# EasyEDA Pro project RM26.epro, board PCB5
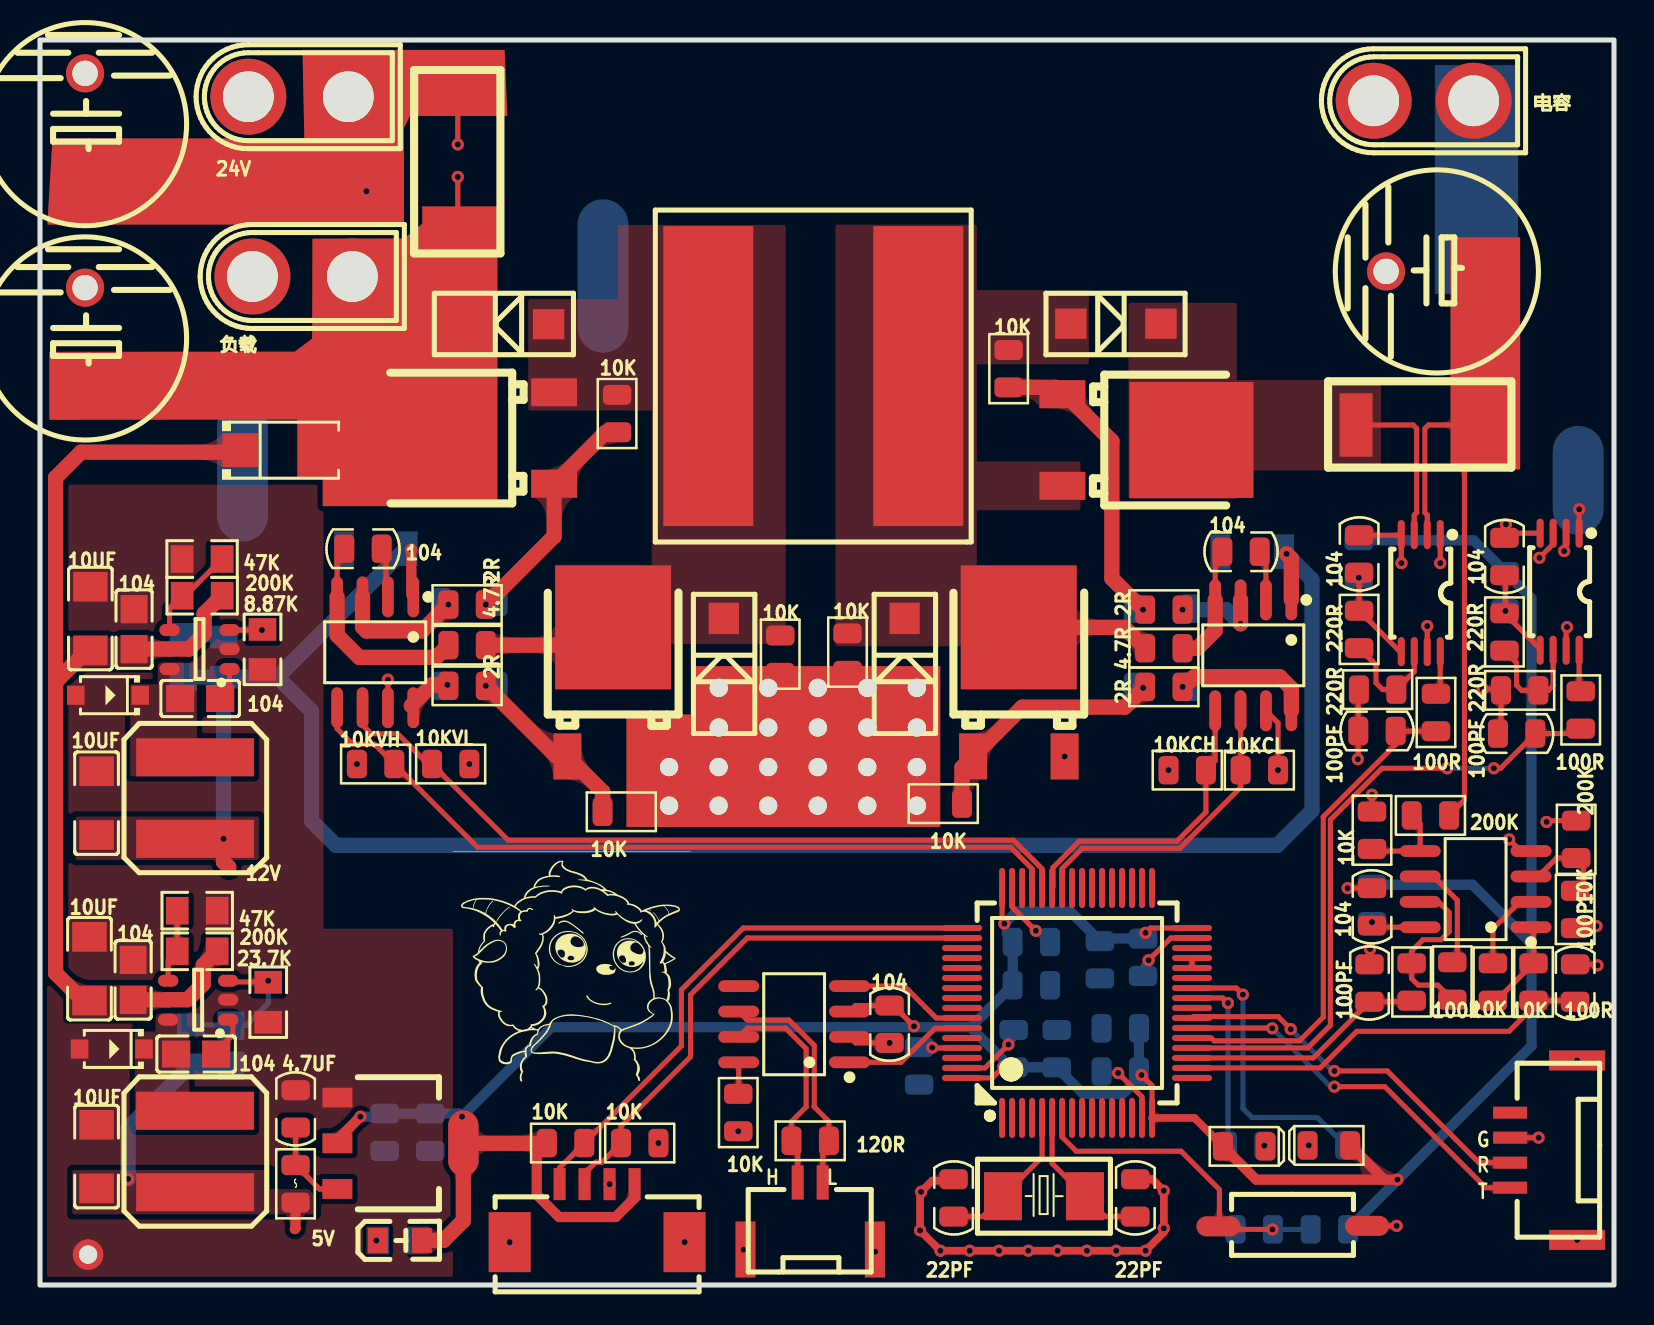
[diagram p4: board, top side]
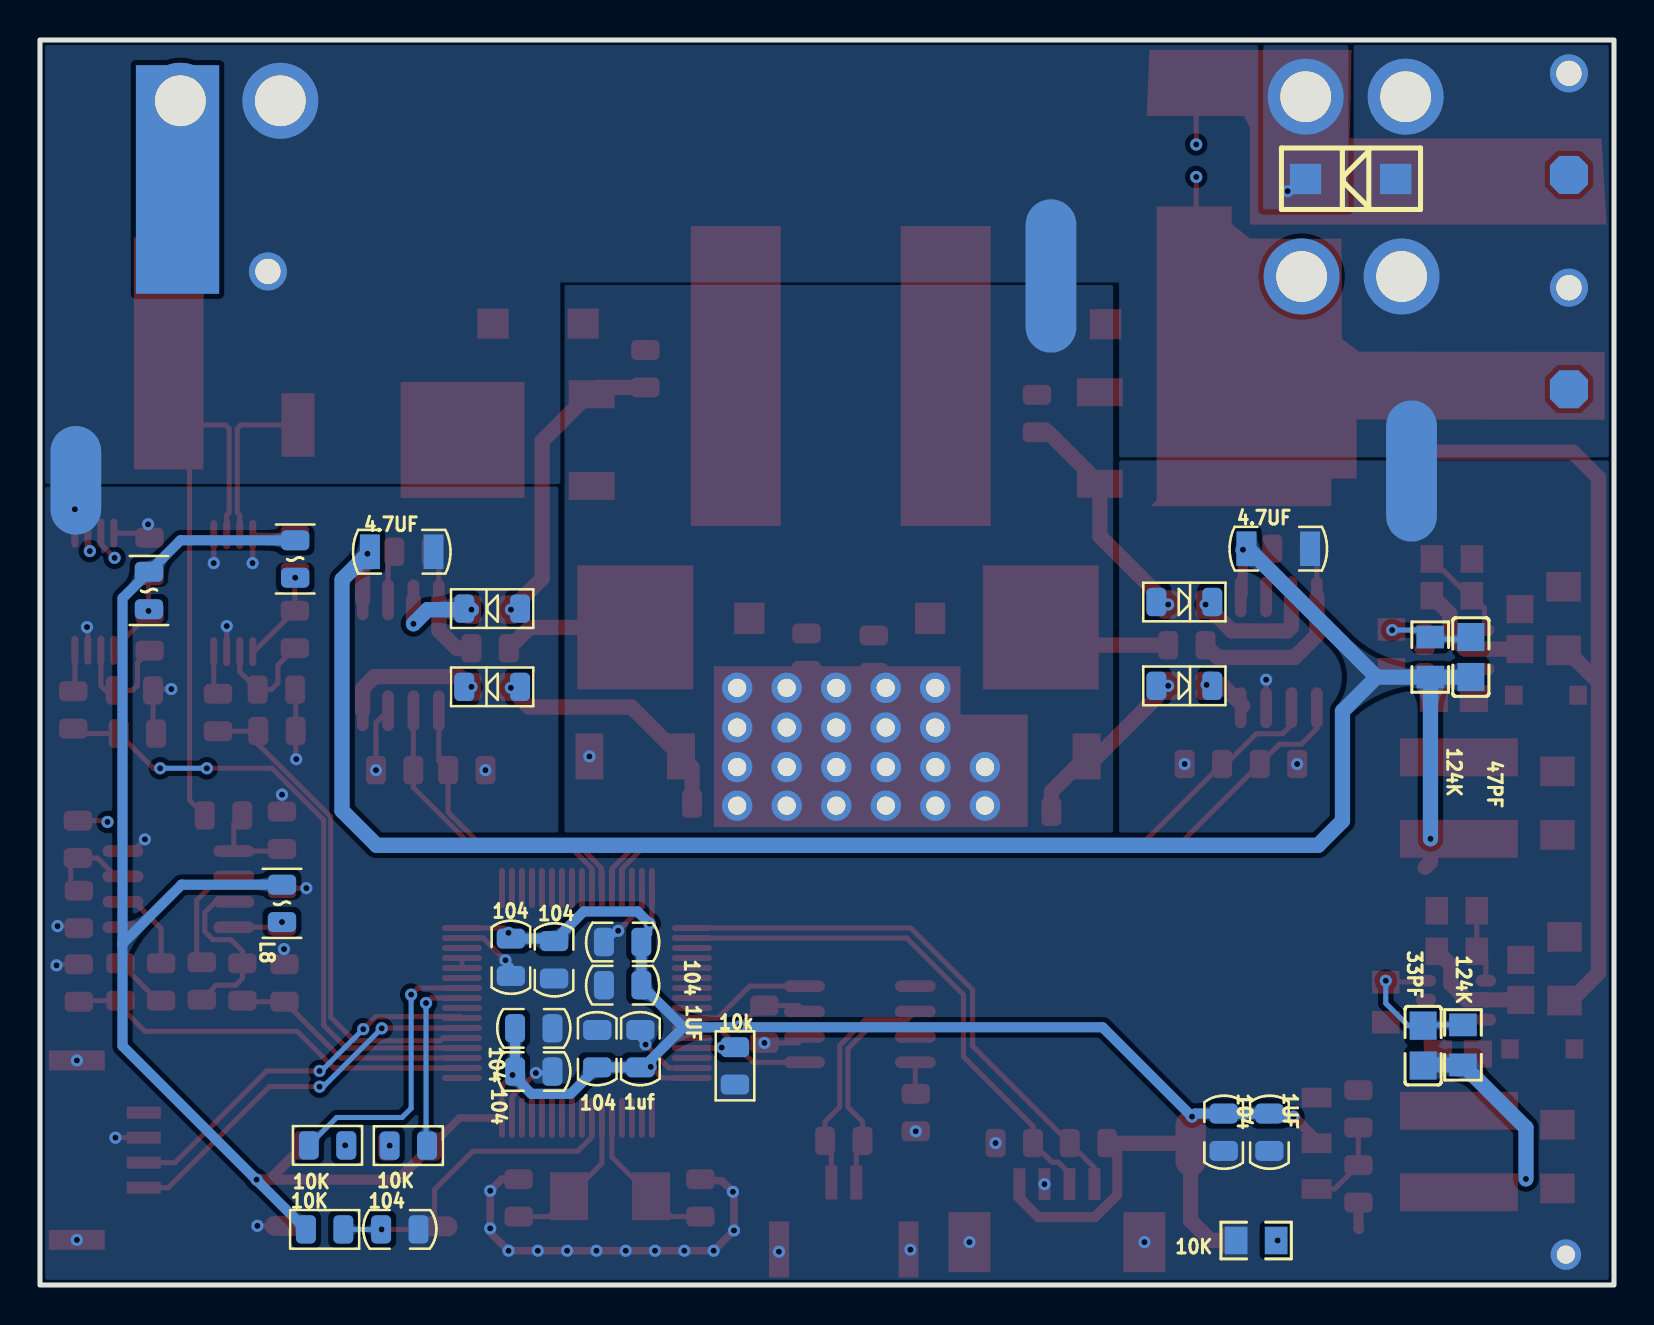
[diagram p5: board, bottom side, seen from below]

Outline 78.73 x 62.27 mm; copper layers: Top Layer, 内层1, Inner2, Bottom Layer. Coordinates in mm from the lower left corner of the outline.
Outline path: rectangle 0,62.27 78.73,0
Stack: Top Layer 0.035mm 外层铜厚1oz / Dielectric1 0.2104mm 7628 RC49% 8.6mil / 内层1 0.0152mm 内层铜厚 / Dielectric2 1.065mm 1.1mm H/HOZ Copper / Inner2 0.0152mm 内层铜厚 / Dielectric3 0.2104mm 7628 RC49% 8.6mil / Bottom Layer 0.035mm 外层铜厚1oz

## Design rules (mm)
template: 自定义配置
spacing copperThickness1oz (default): track to track 0.102, other pairs 0.152 to 0.3
spacing copperThickness2oz: track to track 0.203, other pairs 0.152 to 0.3
track width copperThickness1oz (default): min 0.127, default 0.254, max 2.54
track width copperThickness2oz: min 0.203, default 0.254, max 2.54
differential pair differentialPair (default): width min 0.127, default 0.254, max 2.54; gap min 0.152, default 0.152
via viaSize (default): diameter min 0.5, default 0.61, max 10; hole min 0.3, default 0.305, max 6.3
net GND uses copperRegion1
net 24V_P uses copperRegion1
net 24V uses copperRegion1
net $1N3043 uses copperRegion1
net $1N3042 uses copperRegion1
net 5V uses copperRegion1
net 12V uses copperRegion1
net CAP_P uses copperRegion1
net 24V_N uses copperRegion1
net CAP_N uses copperRegion1
net $1N49246 uses copperRegion1
net $1N49733 uses copperRegion1

## Placement (name value [footprint] x y rotation side)
1UF  -  [0805-C]  17.24 7.64 270 bottom
1uf  1UF  [0805-C]  54.03 12.84 180 bottom
1UF#2  -  [0805-C]  50.86 11.82 90 bottom
2R  -  [0805-R]  21.36 29.97 180 top
2R#2  -  [0805-R]  21.36 34.03 180 top
2R#3  -  [0805-R]  56.21 29.92 0 top
2R#4  -  [0805-R]  56.21 33.78 0 top
4.7R  -  [0805-R]  21.36 32 180 top
4.7R#2  -  [0805-R]  56.21 31.85 0 top
4.7UF  -  [0805-C]  12.79 8.81 90 top
4.7UF#2  -  [C-1206]  16.79 36.83 180 bottom
4.7UF#3  -  [C-1206]  60.63 36.67 0 bottom
5V  -  [Test-Point-0.5mm]  12.75 2.8 270 top
8.87K  8.87kΩ  [R0805]  11.13 31.79 90 top
10K  -  [0805-R]  28.86 43.59 90 top
10k  10K  [0805-R]  43.97 10.96 90 bottom
10K#2  -  [0805-R]  34.93 8.62 90 top
10K#3  -  [0805-R]  37.02 31.55 270 top
10K#4  -  [0805-R]  48.45 45.83 90 top
10K#5  -  [0805-R]  40.39 31.65 270 top
10K#6  -  [0805-R]  29.08 23.67 180 top
10K#7  -  [0805-R]  45.18 24.08 0 top
10K#8  -  [0805-R]  66.62 22.75 270 top
10K#9  -  [0805-R]  76.78 18.78 90 top
10K#10  -  [0805-R]  70.64 15.21 90 top
10K#11  -  [0805-R]  72.67 15.16 90 top
10K#12  -  [0805-R]  26.29 7.1 0 top
10K#13  -  [0805-R]  30 7.1 0 top
10K#14  -  [R0805]  17.9 2.23 180 bottom
10K#15  -  [0805-R]  60.3 6.97 180 bottom
10K#16  -  [0805-R]  64.35 6.98 0 bottom
10K#17  -  [0805-R]  64.49 2.78 0 bottom
10KCH  10K  [0805-R]  57.38 25.75 180 top
10KCL  10K  [0805-R]  60.99 25.75 0 top
10KVH  10K  [0805-R]  16.79 26.06 180 top
10KVL  10K  [0805-R]  20.54 26.06 0 top
10UF  -  [C1206]  2.83 6.42 270 top
10UF#2  -  [C1206]  2.52 33.33 90 top
10UF#3  -  [C1206]  2.83 24.1 270 top
10UF#4  -  [C1206]  2.47 15.82 90 top
12V  -  [Test-Point-0.5mm]  9.45 20.89 270 top
22PF  -  [0805-C]  45.7 4.36 270 top
22PF#2  -  [0805-C]  54.79 4.36 90 top
23.7K  23.7kΩ  [R0805]  11.42 14.14 90 top
24V  XT30U-M  [CONN-TH_XT30U-M]  13.12 50.44 180 top
33PF  33pF  [C0805]  9.55 11.97 90 bottom
47K  -  [R0805]  8.11 36.31 0 top
47K#2  -  [R0805]  7.86 18.72 180 top
47PF  47pF  [C0805]  7.16 31.41 270 bottom
100PF  -  [0805-C]  66.87 27.71 180 top
100PF#2  -  [0805-C]  73.86 27.58 180 top
100PF#3  -  [0805-C]  76.79 15.1 90 top
100PF#4  -  [0805-C]  66.5 15.1 90 top
100R  -  [0805-R]  77.06 28.76 270 top
100R#2  -  [0805-R]  69.83 28.64 270 top
100R#3  -  [0805-R]  74.7 15.16 270 top
100R#4  -  [0805-R]  68.61 15.16 270 top
104  -  [C0805]  8.01 29.33 180 top
104#2  -  [C0805]  7.81 11.55 180 top
104#3  -  [C0805]  4.7 32.81 90 top
104#4  -  [C0805]  4.66 15.26 90 top
104#5  -  [0805-C]  66.63 18.91 90 top
104#6  -  [0805-C]  65.98 36.56 270 top
104#7  -  [0805-C]  73.25 36.44 270 top
104#8  -  [0805-C]  42.5 13.04 90 top
104#9  -  [0805-C]  16.16 36.83 180 top
104#10  -  [0805-C]  60.07 36.67 0 top
104#11  -  [0805-C]  19.52 7.64 270 bottom
104#12  -  [0805-C]  60.73 2.78 180 bottom
104#13  -  [0805-C]  55.18 16.39 270 bottom
104#14  -  [0805-C]  49.59 17.15 0 bottom
104#15  -  [0805-C]  54.03 10.68 180 bottom
104#16  -  [0805-C]  49.59 15 0 bottom
104#17  -  [0805-C]  53.02 16.27 270 bottom
104#18  -  [0805-C]  48.7 11.82 90 bottom
120R  120R  [0805-R]  38.52 7.21 0 top
124K  -  [R0805]  9.19 31.41 270 bottom
124K#2  -  [R0805]  7.55 12.01 270 bottom
200K  -  [R0805]  8.11 34.48 0 top
200K#2  -  [R0805]  7.86 16.69 0 top
200K#3  -  [0805-R]  69.55 23.49 180 top
200K#4  -  [0805-R]  76.84 22.29 270 top
220R  -  [0805-R]  73.25 32.66 90 top
220R#2  -  [0805-R]  65.98 32.79 90 top
220R#3  -  [0805-R]  74.01 29.74 180 top
220R#4  -  [0805-R]  66.9 29.78 180 top
C3  470UF  [C-电解电容]  2.25 58.06 90 top
C23  470UF  [C-电解电容]  69.87 50.7 180 top
C27  470UF  [C-电解电容]  2.25 47.34 90 top
D1  SMBJ30CA  [SMA]  13.18 55.32 0 bottom
D3  1N5819  [SMA_L4.4-W2.6-LS5.0-RD]  12.21 41.75 0 top
D4  1N4148W  [SOD-123_L2.7-W1.6-LS3.7-FD]  3.4 29.5 0 top
D5  1N4148W  [SOD-123_L2.7-W1.6-LS3.7-FD]  3.59 11.81 0 top
D16  led  [0805-LED]  60.24 6.93 0 top
D17  led  [0805-LED]  64.47 6.98 180 top
D24  1n4148  [1n4148 sod-123]  21.49 29.97 180 bottom
D25  1n4148  [1n4148 sod-123]  21.49 34.16 180 bottom
D26  FR107  [SMA]  34.21 31.09 90 top
D27  FR107  [SMA]  43.25 31.09 90 top
D28  FR107  [SMA]  53.82 48.08 0 top
D29  1n4148  [1n4148 sod-123]  56.11 29.92 0 bottom
D30  1n4148  [1n4148 sod-123]  56.11 33.83 0 bottom
D31  FR107  [SMA]  23.18 48.05 180 top
F1  0.5A/0805  [自恢复保险丝-0805]  12.78 5.06 90 top
IC1  OPA2350UA  [OPA2350UA-SOP-8]  71.81 19.8 180 top
J4  CON4  [GH1.25-4P  SWD]  27.86 3.59 0 top
J5  CON2  [GH1.25_2P-立]  38.52 3.45 0 top
J7  CON4  [GH1.25_4P-立]  75.21 6.74 90 top
L3  3.3UH/0530  [L-5020/5030]  7.76 6.68 0 top
L4  10UH  [0805-L]  73.28 34.74 90 bottom
L5  10UH  [0805-L]  65.96 36.31 90 bottom
L8  10UH  [0805-L]  66.62 19.09 90 bottom
L10  15uH  [IND-SMD_L16.5-W15.5]  38.68 45.46 180 top
L11  6.8UH/0530  [L-5020/5030]  7.76 24.35 0 top
LED2  -  [LED_0805]  18.05 2.23 0 top
NOREF  -  [Pad_e4455]  36.43 29.87 0 top
NOREF#2  -  [Pad_e4452]  43.86 29.87 0 top
NOREF#3  -  [Pad_e4465]  36.42 25.91 0 top
NOREF#4  -  [Pad_e4462]  41.38 23.97 0 top
NOREF#5  -  [Pad_e4450]  43.86 25.91 0 top
NOREF#6  -  [Pad_e495]  37.18 26.93 0 top
NOREF#7  -  [Pad_e341]  71.85 55.29 0 top
NOREF#8  -  [Pad_e493]  11.82 44.98 0 top
NOREF#9  -  [Pad_e4454]  38.91 29.87 0 top
NOREF#10  -  [Pad_e4456]  33.95 29.87 0 top
NOREF#11  -  [Pad_e4458]  36.43 27.88 0 top
NOREF#12  -  [Pad_e4449]  43.86 23.97 0 top
NOREF#13  -  [Pad_e4470]  31.46 23.97 0 top
NOREF#14  -  [Pad_e4461]  41.38 25.91 0 top
NOREF#15  -  [Pad_e4459]  38.91 27.88 0 top
NOREF#16  -  [Pad_e2899]  2.41 1.52 0 top
NOREF#17  -  [Pad_e4457]  33.95 27.88 0 top
NOREF#18  -  [Pad_e4451]  43.86 27.88 0 top
NOREF#19  -  [Pad_e4463]  38.9 23.97 0 top
NOREF#20  -  [Pad_e4464]  38.9 25.91 0 top
NOREF#21  -  [Pad_e492]  11.87 55.19 0 top
NOREF#22  -  [Pad_e4468]  33.94 23.97 0 top
NOREF#23  -  [Pad_e4466]  36.42 23.97 0 top
NOREF#24  -  [Pad_e4460]  41.38 27.88 0 top
NOREF#25  -  [Pad_e4467]  33.94 25.91 0 top
NOREF#26  -  [Pad_e4453]  41.38 29.87 0 top
NOREF#27  -  [Pad_e340]  72.29 46.59 0 top
NOREF#28  -  [Pad_e4469]  31.46 25.91 0 top
Q27  TMGN10080D  [TO-252-3_L6.5-W6.1-P4.58-BR]  22.49 42.36 0 top
Q28  TMGN10080D  [TO-252-3_L6.5-W6.1-P4.58-BR]  28.67 29.66 270 top
Q29  TMGN10080D  [TO-252-3_L6.5-W6.1-P4.58-BR]  54.37 42.26 180 top
Q30  TMGN10080D  [TO-252-3_L6.5-W6.1-P4.58-BR]  48.96 29.66 270 top
R1  R005  [R-2512]  20.9 56.23 270 top
R27  R005  [R-2512]  69.06 43.02 180 top
S1  -  [按键]  62.66 2.95 180 top
U3  mp2451  [MP2451-SOT23-6]  7.98 31.78 180 top
U4  mp2451  [MP2451-SOT23-6]  7.91 14.25 180 top
U6  AMS1117  [AMS117-SOT-223]  18.03 7.09 270 top
U8  INA240A1PWR  [INA240-TSSOP-8]  76.01 34.68 270 top
U9  INA240A1PWR  [INA240-TSSOP-8]  69.06 34.6 270 top
U14  STM32G474RET6  [LQFP-64_L10.0-W10.0-P0.50-LS12.0-BL]  51.87 14.11 0 top
U15  SN65HVD230  [SOP-8]  37.72 13.04 180 top
U16  UCC27282DR  [SOIC-8_L4.9-W3.9-P1.27-LS6.0-BL]  16.77 31.65 180 top
U17  UCC27282DR  [SOIC-8_L4.9-W3.9-P1.27-LS6.0-BL]  60.68 31.49 180 top
X1  8M  [晶振2脚-5032]  50.22 4.44 180 top
电容  XT30U-M  [CONN-TH_XT30U-M]  69.21 59.23 180 top
负载  XT30U-M  [CONN-TH_XT30U-M]  12.92 59.43 180 top

## Footprints (pads in the part's own frame, mm; a bottom-side part is the same pattern mirrored in y, then rotated)
1n4148 sod-123
  rrect 1x1.42 smd: 1(-1.397,0) 2(1.397,0)
0805-C
  rrect 1x1.42 smd: 1(-0.935,0) 2(0.935,0)
0805-L
  rrect 1x1.42 smd: 1(-0.935,0) 2(0.935,0)
0805-LED
  rrect 1x1.42 smd: 1(-1.067,0) 2(1.067,0)
0805-R
  rrect 1x1.42 smd: 1(-0.935,0) 2(0.935,0)
AMS117-SOT-223
  rect 0.991x1.498 smd: 1(-2.286,-3.15) 2(0,-3.15) 3(2.286,-3.15)
  oval 3.28x1.524 smd: 2(0,3.15)
C0805
  rect 1.41x1.35 smd: 1(-1,0) 2(1,0)
C1206
  rect 1.485x1.728 smd: 1(-1.593,0) 2(1.593,0)
C-1206
  rect 1x1.728 smd: 1(-1.593,0) 2(1.593,0)
C-电解电容
  custom 1.905x1.905 hole 1.143: 1(-2.54,0)
  round 1.905 hole 1.27: 2(2.54,0)
CONN-TH_XT30U-M
  round 3.8 hole 2.54: 1(-2.5,0) 2(2.5,0)
GH1.25-4P  SWD
  rect 0.6x1.6 smd: 1(-1.875,1.45) 2(-0.625,1.45) 3(0.625,1.45) 4(1.875,1.45)
  rect 2.1x3 smd: 5(4.375,-1.45) 6(-4.375,-1.45)
GH1.25_2P-立
  rect 0.6x1.7 smd: 1(-0.625,1.675) 2(0.625,1.675)
  rect 1x2.8 smd: 3(3.237,-1.675) 4(-3.237,-1.675)
GH1.25_4P-立
  rect 0.6x1.7 smd: 1(-1.875,1.675) 2(-0.625,1.675) 3(0.625,1.675) 4(1.875,1.675)
  rect 1x2.8 smd: 5(4.487,-1.675) 6(-4.487,-1.675)
INA240-TSSOP-8
  oval 1.454x0.353 smd: 1(-2.927,0.975) 2(-2.927,0.325) 3(-2.927,-0.325) 4(-2.927,-0.975) 5(2.927,-0.975) 6(2.927,-0.325) 7(2.927,0.325) 8(2.927,0.975)
IND-SMD_L16.5-W15.5
  rect 4.5x15 smd: 1(5.25,0) 2(-5.25,0)
L-5020/5030
  rect 5.9x1.9 smd: 1(0,2.038) 2(0,-2.038)
LED_0805
  rect 1x1.25 smd: 1(-1.15,0.005) 2(1.05,0.005)
LQFP-64_L10.0-W10.0-P0.50-LS12.0-BL
  oval 0.3x2 smd: 1(-3.75,-5.75) 2(-3.25,-5.75) 3(-2.75,-5.75) 4(-2.25,-5.75) 5(-1.75,-5.75) 6(-1.25,-5.75) 7(-0.75,-5.75) 8(-0.25,-5.75) 9(0.25,-5.75) 10(0.75,-5.75) 11(1.25,-5.75) 12(1.75,-5.75) 13(2.25,-5.75) 14(2.75,-5.75) 15(3.25,-5.75) 16(3.75,-5.75) 33(3.75,5.75) 34(3.25,5.75) 35(2.75,5.75) 36(2.25,5.75) 37(1.75,5.75) 38(1.25,5.75) 39(0.75,5.75) 40(0.25,5.75) 41(-0.25,5.75) 42(-0.75,5.75) 43(-1.25,5.75) 44(-1.75,5.75) 45(-2.25,5.75) 46(-2.75,5.75) 47(-3.25,5.75) 48(-3.75,5.75)
  oval 2x0.3 smd: 17(5.75,-3.75) 18(5.75,-3.25) 19(5.75,-2.75) 20(5.75,-2.25) 21(5.75,-1.75) 22(5.75,-1.25) 23(5.75,-0.75) 24(5.75,-0.25) 25(5.75,0.25) 26(5.75,0.75) 27(5.75,1.25) 28(5.75,1.75) 29(5.75,2.25) 30(5.75,2.75) 31(5.75,3.25) 32(5.75,3.75) 49(-5.75,3.75) 50(-5.75,3.25) 51(-5.75,2.75) 52(-5.75,2.25) 53(-5.75,1.75) 54(-5.75,1.25) 55(-5.75,0.75) 56(-5.75,0.25) 57(-5.75,-0.25) 58(-5.75,-0.75) 59(-5.75,-1.25) 60(-5.75,-1.75) 61(-5.75,-2.25) 62(-5.75,-2.75) 63(-5.75,-3.25) 64(-5.75,-3.75)
MP2451-SOT23-6
  oval 1.016x0.6 smd: 1(-1.5,0.975) 2(-1.5,-0.025) 3(-1.5,-0.975) 4(1.5,-0.975) 5(1.5,-0.025) 6(1.5,0.975)
OPA2350UA-SOP-8
  oval 2.045x0.588 smd: 1(-2.772,1.905) 2(-2.772,0.635) 3(-2.772,-0.635) 4(-2.772,-1.905) 5(2.772,-1.905) 6(2.772,-0.635) 7(2.772,0.635) 8(2.772,1.905)
Pad_e340
  rect 3.482x11.608 smd: 2(0,0)
Pad_e341
  rect 4.165x11.43 smd far side: 2(0,0)
Pad_e492
  custom 23.005x8.737 smd: 1(0,0)
Pad_e493
  custom 22.71x15.04 smd: 65(0,0)
Pad_e495
  custom 15.696x8.046 smd: 66(0,0)
Pad_e2899
  round 1.524 hole 0.914: 1(0,0)
Pad_e4449
  round 1.524 hole 0.914: 1(0,0)
Pad_e4450
  round 1.524 hole 0.914: 2(0,0)
Pad_e4451
  round 1.524 hole 0.914: 3(0,0)
Pad_e4452
  round 1.524 hole 0.914: 4(0,0)
Pad_e4453
  round 1.524 hole 0.914: 5(0,0)
Pad_e4454
  round 1.524 hole 0.914: 6(0,0)
Pad_e4455
  round 1.524 hole 0.914: 7(0,0)
Pad_e4456
  round 1.524 hole 0.914: 8(0,0)
Pad_e4457
  round 1.524 hole 0.914: 9(0,0)
Pad_e4458
  round 1.524 hole 0.914: 10(0,0)
Pad_e4459
  round 1.524 hole 0.914: 11(0,0)
Pad_e4460
  round 1.524 hole 0.914: 12(0,0)
Pad_e4461
  round 1.524 hole 0.914: 13(0,0)
Pad_e4462
  round 1.524 hole 0.914: 14(0,0)
Pad_e4463
  round 1.524 hole 0.914: 15(0,0)
Pad_e4464
  round 1.524 hole 0.914: 16(0,0)
Pad_e4465
  round 1.524 hole 0.914: 17(0,0)
Pad_e4466
  round 1.524 hole 0.914: 18(0,0)
Pad_e4467
  round 1.524 hole 0.914: 19(0,0)
Pad_e4468
  round 1.524 hole 0.914: 20(0,0)
Pad_e4469
  round 1.524 hole 0.914: 21(0,0)
Pad_e4470
  round 1.524 hole 0.914: 22(0,0)
R0805
  rect 1.133x1.377 smd: 1(-1,0) 2(1,0)
R-2512
  rect 1.651x3.175 smd: 1(-3.238,0) 2(3.238,0)
SMA
  rect 1.57x1.51 smd: 1(-2.255,0) 2(2.255,0)
SMA_L4.4-W2.6-LS5.0-RD
  rect 1.8x1.7 smd: 1(-2.192,0) 2(2.192,0)
SOD-123_L2.7-W1.6-LS3.7-FD
  rect 0.88x0.96 smd: 1(-1.61,0) 2(1.61,0)
SOIC-8_L4.9-W3.9-P1.27-LS6.0-BL
  oval 0.588x2.045 smd: 1(-1.905,-2.772) 2(-0.635,-2.772) 3(0.635,-2.772) 4(1.905,-2.772) 5(1.905,2.772) 6(0.635,2.772) 7(-0.635,2.772) 8(-1.905,2.772)
SOP-8
  oval 2.045x0.588 smd: 1(-2.772,1.905) 2(-2.772,0.635) 3(-2.772,-0.635) 4(-2.772,-1.905) 5(2.772,-1.905) 6(2.772,-0.635) 7(2.772,0.635) 8(2.772,1.905)
Test-Point-0.5mm
  round 0.5 smd: 1(0,0)
TO-252-3_L6.5-W6.1-P4.58-BR
  rect 2.3x1.4 smd: 1(3.228,-2.29) 3(3.228,2.29)
  rect 6.2x5.8 smd: 2(-3.228,-0.004)
按键
  rrect 2.2x1 smd: 1(-3.721,-0.013) 2(3.721,0.013)
晶振2脚-5032
  rect 1.9x2.4 smd: 1(-2.05,0) 2(2.05,0)
自恢复保险丝-0805
  rrect 1x1.42 smd: 1(-0.935,0) 2(0.935,0)

## Nets
5V: 5V.1 10UF.2 33PF.1 124K#2.2 F1.1 L3.2
12V: 4.7UF#2.1 4.7UF#3.2 10UF#3.2 12V.1 47PF.2 124K.2 L11.2 U16.1 U17.1
24V: 10UF#2.1 10UF#4.1 104#3.1 104#4.1 200K.2 200K#2.2 D3.1 U3.5 U4.5
24V_N: 24V.1 C27.1 D3.2 D31.2 NOREF#8.65 Q27.2 R1.2 U8.3
24V_P: 200K#4.1 C3.1 D1.2 NOREF#21.1 R1.1 U8.2 负载.1
GND: 1UF.2 1uf.2 1UF#2.2 4.7UF.2 4.7UF#2.2 4.7UF#3.1 8.87K.1 10k.1 10K#2.1 10K#3.2 10K#5.2 10K#6.1 10K#7.1 10K#8.1 10K#9.1 10K#13.2 10K#14.1 10KCH.2 10KCL.2 10KVH.2 10KVL.2 10UF.1 10UF#2.2 10UF#3.1 10UF#4.2 22PF.1 22PF#2.2 23.7K.1 24V.2 47K.1 47K#2.1 100PF.2 100PF#2.2 100PF#3.2 100PF#4.2 104#3.2 104#4.2 104#5.2 104#6.1 104#7.1 104#8.1 104#11.2 104#12.2 104#13.2 104#14.2 104#15.2 104#16.2 104#17.2 104#18.2 220R#3.2 220R#4.2 C3.2 C23.2 C27.2 D1.1 D4.1 D5.1 D26.1 D27.1 IC1.4 J4.3 J4.5 J4.6 J5.3 J5.4 J7.3 J7.5 J7.6 NOREF.7 NOREF#2.4 NOREF#3.17 NOREF#4.14 NOREF#5.2 NOREF#6.66 NOREF#9.6 NOREF#10.8 NOREF#11.10 NOREF#12.1 NOREF#13.22 NOREF#14.13 NOREF#15.11 NOREF#16.1 NOREF#17.9 NOREF#18.3 NOREF#19.15 NOREF#20.16 NOREF#22.20 NOREF#23.18 NOREF#24.12 NOREF#25.19 NOREF#26.5 NOREF#28.21 Q28.3 Q30.3 S1.1 U3.2 U4.2 U6.1 U8.1 U8.4 U8.7 U9.1 U9.4 U9.7 U14.15 U14.31 U14.47 U14.63 U15.2 U16.7 U17.7 电容.2 负载.2
VCC: 1UF.1 1uf.1 1UF#2.1 10K#12.1 10K#17.2 104#8.2 104#11.1 104#13.1 104#14.1 104#15.1 104#16.1 104#17.1 104#18.1 D16.1 D17.1 J4.4 L4.2 L5.2 L8.2 LED2.2 U6.2 U14.16 U14.32 U14.48 U14.64 U15.3
VDDA: U14.28 U14.29
VSSA: U14.27
ADC24I: 100PF#2.1 100R.2 U14.20
ADC24V: 100PF#3.1 100R#3.2 U14.18
ADCCAPI: 100PF.1 100R#2.2 U14.21
ADCCAPV: 100PF#4.1 100R#4.2 U14.19
CAN1_N: 120R.2 J5.2 U15.6
CAN1_P: 120R.1 J5.1 U15.7
CAN2RXPB5: U14.58 U15.4
CAN2TXPB6: U14.59 U15.1
CAP_N: D28.2 Q29.2 R27.2 U9.3
CAP_P: 200K#3.1 C23.1 NOREF#7.2 NOREF#27.2 R27.1 U9.2 电容.1
I2C1SCLPC8: U14.40
I2C1SDAPC9: U14.41
LED1(PC1): 10K#15.2 U14.25
LED2(PC2): 10K#16.2 U14.26
NRST: 10K#17.1 104#12.1 S1.2 U14.7
PWM24VH: 10KVH.1 U14.45 U16.5
PWM24VL: 10KVL.1 U14.44 U16.6
PWMCAPH: 10KCH.1 U14.43 U17.5
PWMCAPL: 10KCL.1 U14.42 U17.6
SWCLK(PA14): 10K#13.1 J4.2 U14.50
SWDIO(PA13): 10K#12.2 J4.1 U14.49
USART1RXPC5: J7.2 U14.23
USART1TXPC4: J7.1 U14.22
$1N3030: 47K.2 200K.1 U3.4
$1N3033: 47K#2.2 200K#2.1 U4.4
$1N3035: 104#2.1 U4.1
$1N3038: 104.1 U3.1
$1N3042: 104#2.2 D5.2 L3.1 U4.6
$1N3043: 104.2 D4.2 L11.1 U3.6
$1N3044: 23.7K.2 33PF.2 124K#2.1 U4.3
$1N3046: 4.7UF.1 F1.2 U6.3
$1N3061: 8.87K.2 47PF.1 124K.1 U3.3
$1N3102: 10K#14.2 LED2.1
$1N13243: 10K#15.1 D16.2
$1N13247: 10K#16.1 D17.2
$1N13249: 10K#2.2 U15.8
$1N13864: 22PF#2.1 U14.6 X1.1
$1N13870: 22PF.2 U14.5 X1.2
$1N14105: U14.34
$1N14109: U14.35
$1N14240: 10k.2 U14.61
$1N17159: U14.12
$1N17163: U14.13
$1N17168: U14.14
$1N17173: U14.17
$1N17276: U14.30
$1N17281: U14.33
$1N17287: U14.56
$1N17293: U14.51
$1N17327: U14.39
$1N17331: U14.38
$1N18673: 104#7.2 220R.2 L4.1 U8.5
$1N18685: 104#6.2 220R#2.2 L5.1 U9.5
$1N18690: 220R.1 220R#3.1 U8.6
$1N18696: 100R.1 U8.8
$1N18706: 220R#2.1 220R#4.1 U9.6
$1N18712: 100R#2.1 U9.8
$1N18744: 10K#8.2 200K#3.2 IC1.5
$1N18747: 10K#10.2 IC1.6
$1N18750: 10K#11.2 IC1.2
$1N18753: 104#5.1 IC1.8 L8.1
$1N18755: 10K#10.1 100R#4.1 IC1.7
$1N18758: 10K#11.1 100R#3.1 IC1.1
$1N18785: 10K#9.2 200K#4.2 IC1.3
$1N24674: U14.24
$1N24682: U14.37
$1N24686: U14.36
$1N28318: U14.57
$1N49088: 104#9.1 U16.2
$1N49141: 4.7R.2 104#9.2 U16.4
$1N49155: 2R#2.2 D25.2 U16.3
$1N49185: 2R.2 D24.2 U16.8
$1N49210: 2R#2.1 10K.1 D25.1 Q27.1
$1N49246: 4.7R.1 10K.2 10K#3.1 D26.2 D31.1 L10.1 Q27.3 Q28.2
$1N49364: 2R.1 10K#6.2 D24.1 Q28.1
$1N49733: 4.7R#2.1 10K#4.2 10K#5.1 D27.2 D28.1 L10.2 Q29.3 Q30.2
$1N50072: 2R#4.1 10K#4.1 D30.1 Q29.1
$1N50092: 2R#3.1 10K#7.2 D29.1 Q30.1
$1N50323: 4.7R#2.2 104#10.1 U17.4
$1N50327: 2R#4.2 D30.2 U17.3
$1N50344: 2R#3.2 D29.2 U17.8
$1N50364: 104#10.2 U17.2

Pads without a net: J7 4; U14 1 2 3 4 8 9 10 11 46 52 53 54 55 60 62; U15 5

## Via types
v1: diameter 0.61, hole 0.305, Top Layer to Bottom Layer, 93 vias

## Routing (per net, layer and track width the routed paths; a pad name or vN(x,y) marks a point on that pad's centre or on a via; arc(x,y) is an arc through that point)
5V: length 10.4
  Top Layer w0.508: 5V.1 12.78,2.83 F1.1
  Bottom Layer w0.762: 33PF.1 9.51,11.01 124K#2.2 4.41,7.86 v1(4.41,5.3)
12V: length 101
  Top Layer w0.508: 18.57,34.52 18.57,36.77 v1(18.56,36.78)
  Top Layer w0.762: v1(62.35,36.57) 62.59,36.33 62.59,34.27 ; 12V.1 9.18,21.16 v1(9.18,22.32)
  Bottom Layer w0.762: v1(9.18,22.32) 9.18,30.39 124K.2 ; 4.7UF#3.2 63.62,35.28 63.62,23.72 61.89,21.99 14.8,21.99 13.58,23.21 13.58,28.7 11.87,30.41 ; 11.87,30.41 18.24,36.78 v1(18.56,36.78) ; 11.87,30.41 124K.2 ; 47PF.2 124K.2
24V: length 50.9
  Top Layer w0.762: 9.92,41.65 2.05,41.65 0.78,40.38 0.78,30.16 ; 200K.2 8.21,33.58 8.21,32.57 7.45,31.81 U3.5 4.7,31.81 104#3.1 ; 2.42,14.19 2.18,14.19 0.78,15.6 0.78,30.16 ; 0.78,30.16 2.36,31.74 10UF#2.1 ; 104#4.1 6.4,14.26 U4.5 7.38,14.27 8.16,15.06 8.16,15.99 200K#2.2
24V_N: length 75.6
  Top Layer w0.254: R1.2 v1(20.9,55.42) ; v1(75,36.37) 75,36.37 75.68,37.06 U8.3
  Inner2 w0.254: v1(20.9,55.42) 21.41,55.93 71.14,55.93 75,52.07 v1(75,36.37)
24V_P: length 164.8
  Top Layer w0.254: v1(75.35,23.16) 75.42,23.22 200K#4.1 ; R1.1 v1(20.9,57.05) ; v1(76.24,36.71) 76.33,36.81 U8.2
  Inner2 w0.254: v1(20.9,57.05) 21.41,56.54 71.1,56.54 76.24,51.4 v1(76.24,36.71) ; v1(16.33,54.71) 18.46,54.71 24.91,48.26 24.91,23.87 27.09,21.69 73.88,21.69 v1(75.35,23.16)
GND: length 109.1
  Top Layer w0.254: v1(42.5,12.11) 40.79,12.11 U15.2 ; v1(76.99,38.8) 76.99,37.61 U8.1 ; v1(68.1,36.11) 68.09,36.12 U9.4 68.06,37.5 104#6.1 ; v1(66.52,16.8) 66.52,16.06 100PF#4.2 ; 220R#4.2 65.94,29.75 100PF.2 65.94,26.33 v1(65.91,26.3) ; 104#7.1 73.32,37.45 73.32,37.6 ; 10K#8.1 v1(66.62,24.52) ; U9.7 v1(69.39,32.96) ; v1(61.92,25.75) 61.92,28.12 U17.7 ; v1(73.48,22.29) 74.07,21.71 IC1.4 ; v1(55.45,16.24) 56.56,17.36 U14.31 ; v1(53.93,10.61) 55.12,9.41 U14.15 ; 100PF#2.2 73.08,27.73 220R#3.2 73.01,29.81 v1(72.16,29.81) ; v1(48.44,12.03) 47.27,10.86 U14.63 ; v1(77.85,17.95) 76.89,17.95 10K#9.1 ; 73.32,37.6 v1(73.32,38.05) ; 73.32,37.6 U8.4 ; J7.3 v1(74.96,7.37) ; 100PF#3.2 77.85,16.04 v1(77.9,15.99) ; U8.7 76.33,32.86 v1(76.38,32.91) ; v1(67.86,2.96) S1.1 ; U9.1 v1(70.04,36.11) ; U14.47 48.62,18.9 48.95,18.58 48.95,18.58 v1(49.81,17.72) ; 104#5.2 v1(65.41,19.85) ; U16.7 v1(17.4,30.27)
  Top Layer w0.381: 22PF.1 45.62,5.22 44.63,5.22 v1(44.07,4.66) 44.02,4.61 v1(44.02,2.73) 45.03,1.72 v1(45.03,1.72) v1(46.5,1.72) v1(47.97,1.72) v1(49.43,1.72) v1(50.9,1.72) v1(52.36,1.72) v1(53.83,1.72) v1(55.3,1.72) 56.21,2.63 v1(56.21,2.83) v1(56.21,4.71) 55.63,5.29 22PF#2.2
  内层1 w2.54: 69.84,10.11 69.84,13.41 ; 8.4,38.2 8.4,43.43 ; 58.18,37.54 58.18,41.15
  Inner2 w2.54: 8.3,43.38 8.3,38.05 ; 71.6,14.75 71.6,9.42 ; 58.44,42.21 58.44,37.18
  Bottom Layer w0.254: v1(53.93,10.61) 53.17,10.61 104#15.2 ; v1(48.44,12.03) 48.7,12.29 104#18.2 ; v1(55.45,16.24) 55.18,15.97 104#13.2 ; v1(49.81,17.72) 50.37,17.15 104#14.2
  Bottom Layer w2.54: 10.13,42.97 10.13,38.45 ; 76.94,41.69 76.94,38.8 ; 28.16,53.03 28.16,47.9
  vias: v1(15.85,26.06) v1(21.48,26.06) v1(23.49,2.14) v1(28.49,5.04) v1(30.93,7.1) v1(32.24,2.14) v1(34.93,7.69) v1(35.19,1.77) v1(41.77,1.67) v1(51.25,26.44) v1(56.45,25.75) v1(76.88,11.23) v1(76.88,2.26)
VCC: length 165.7
  Top Layer w0.254: U14.48 48.12,18.19 v1(48.24,18.07) ; v1(55.3,17.62) 55.54,17.86 U14.32 ; U14.16 55.62,9.97 v1(55.09,10.5) ; U15.3 40.79,13.98 104#8.2 42.68,13.98 v1(43.71,12.94) ; v1(48.18,10.91) 47.63,10.36 U14.64
  Top Layer w0.381: U14.16 57.75,8.36 59.17,6.93
  Top Layer w0.508: v1(16.03,8.42) 14.88,7.27 U6.2 ; J4.4 29.74,4.35 28.79,3.4 25.96,3.4 24.85,4.51 24.85,6.59 25.34,7.09 ; v1(21.11,8.42) 21.18,8.35 U6.2 ; D17.1 67.24,5.27 ; 67.24,5.27 60.83,5.27 59.17,6.93 ; 67.24,5.27 v1(67.9,5.27)
  Top Layer w0.762: 10K#12.1 25.34,7.09 U6.2 21.18,3.22 20.18,2.23 19.1,2.23
  Bottom Layer w0.254: v1(48.24,18.07) 48.24,17.57 104#14.1 ; v1(55.3,17.62) 55.3,17.45 55.21,17.36 ; v1(55.09,10.5) 54.97,10.63 ; 104#18.1 48.67,10.91 v1(48.18,10.91)
  Bottom Layer w0.508: v1(16.03,8.42) 17.08,8.42 17.23,8.57 ; 46.55,12.89 48.18,11.25 v1(48.18,10.91) ; 46.55,12.89 104#16.1 104#14.1 ; 46.55,12.89 25.58,12.89 v1(21.11,8.42) 20.95,8.58 104#11.1 19.52,8.57 17.23,8.57 ; 17.23,8.57 1UF.1 ; 10K#17.2 74.6,11.96 74.6,17.07 ; 104#13.1 53.14,17.33 104#17.1 51.53,18.68 48.84,18.68 v1(48.24,18.07) ; 74.6,17.07 71.65,20.02 L8.2 ; 74.6,17.07 74.6,34.35 L4.2 71.71,37.25 L5.2 ; 104#18.1 1UF#2.1 52.18,9.56 54.15,9.56 v1(55.09,10.5) ; 104#15.1 1uf.1
VDDA: length 0.5
  Top Layer w0.254: U14.28 U14.29
ADC24I: length 32.1
  Top Layer w0.254: v1(72.72,25.85) 73.06,25.85 100PF#2.1 76.82,27.58 100R.2 ; U14.20 63.41,11.86 64.54,12.99 64.54,23.27 67.12,25.85 v1(70.38,25.85)
  Bottom Layer w0.254: v1(72.72,25.85) v1(70.38,25.85)
ADC24V: length 20.8
  Top Layer w0.254: U14.18 64.03,10.86 65.86,12.69 73.47,12.69 74.7,13.92 100R#3.2 76.74,14.22 100PF#3.1
ADCCAPI: length 24.9
  Top Layer w0.254: U14.21 58.58,12.36 58.72,12.21 63,12.21 64.19,13.4 64.19,23.42 67.81,27.04 100PF.1 67.82,27.7 100R#2.2
ADCCAPV: length 12.2
  Top Layer w0.254: U14.19 63.69,11.36 100PF#4.1 68.56,14.17 100R#4.2
CAN1_N: length 11.8
  Top Layer w0.254: J5.2 39.15,6.9 120R.2 39.46,8.17 38.73,8.91 38.73,11.99 37.46,13.26 35.37,13.26 U15.6
CAN1_P: length 11.1
  Top Layer w0.254: J5.1 37.9,6.9 120R.1 37.59,8.17 38.32,8.91 38.32,11.82 37.29,12.85 35.39,12.85 U15.7
CAN2RXPB5: length 6.3
  Top Layer w0.254: U14.58 44.82,13.36 43.23,14.95 U15.4
CAN2TXPB6: length 6.3
  Top Layer w0.254: U14.59 46.11,12.84 44.77,12.84 43.07,11.14 U15.1
CAP_N: length 8.5
  Top Layer w0.254: U9.3 68.74,38.51 68.86,38.63 68.86,42.84 68.68,43.02 R27.2
CAP_P: length 28.7
  Top Layer w0.254: 200K#3.1 71.25,24.25 71.25,41.96 R27.1 69.45,43.02 69.27,42.84 69.27,38.63 69.39,38.51 U9.2
LED1(PC1): length 9.1
  Top Layer w0.254: v1(59.42,14.1) 59.17,14.36 U14.25
  Bottom Layer w0.254: v1(59.42,14.1) 59.42,7.02 10K#15.2
LED2(PC2): length 14.3
  Top Layer w0.254: U14.26 59.83,14.86 v1(60.17,14.53)
  Bottom Layer w0.254: v1(60.17,14.53) 60.17,8.84 60.62,8.38 63.89,8.38 10K#16.2
NRST: length 16.4
  Top Layer w0.254: v1(61.65,2.78) 59.09,2.78 58.99,2.88 58.99,4.78 57.07,6.69 51.83,6.69 51.12,7.4 U14.7
  Bottom Layer w0.254: 63.56,2.78 v1(61.65,2.78)
PWM24VH: length 39.7
  Top Layer w0.254: U16.5 14.86,27.83 15.64,27.05 16.73,27.05 10KVH.1 21.89,21.89 48.54,21.89 49.62,20.81 U14.45
PWM24VL: length 38.9
  Top Layer w0.254: U14.44 50.12,20.82 48.69,22.25 23.42,22.25 10KVL.1 19.53,25.98 19.48,25.98 17.89,27.57 16.57,27.57 16.13,28.01 U16.6
PWMCAPH: length 15.1
  Top Layer w0.254: U17.5 58.78,26.21 10KCH.1 58.32,23.65 56.86,22.2 51.99,22.2 50.67,20.88 50.67,19.9 U14.43
PWMCAPL: length 15.4
  Top Layer w0.254: U17.6 60.05,28.72 10KCL.1 60.05,24.88 57.01,21.84 52.13,21.84 51.12,20.83 U14.42
SWCLK(PA14): length 26.6
  Top Layer w0.254: J4.2 27.24,5.58 27.8,6.14 28.11,6.14 10K#13.1 29.06,7.94 32.54,11.42 32.54,14.52 35.38,17.36 U14.50
SWDIO(PA13): length 27.6
  Top Layer w0.254: U14.49 35.17,17.86 32.08,14.77 32.08,11.96 10K#12.2 25.99,5.86 J4.1
USART1RXPC5: length 19.1
  Top Layer w0.254: v1(62.56,12.8) 61.93,13.42 57.69,13.42 U14.23 ; v1(64.75,10.71) 67.39,10.71 71.97,6.12 73.69,6.12
  Bottom Layer w0.254: v1(62.56,12.8) 64.65,10.71 v1(64.75,10.71)
USART1TXPC4: length 19.2
  Top Layer w0.254: v1(64.75,9.92) 67.26,9.92 72.31,4.87 J7.1 ; v1(61.63,12.84) 61.62,12.86 U14.22
  Bottom Layer w0.254: v1(61.63,12.84) 64.56,9.92 v1(64.75,9.92)
$1N3030: length 4.7
  Top Layer w0.254: U3.4 6.48,33.84 200K.1 7.27,34.48 47K.2
$1N3033: length 3.7
  Top Layer w0.254: U4.4 6.41,16.24 200K#2.1 47K#2.2
$1N3035: length 1.8
  Top Layer w0.254: 8.89,11.77 9.65,12.52 9.65,13.21
$1N3038: length 1.7
  Top Layer w0.254: U3.1 9.48,30 8.85,29.37
$1N3044: length 7.3
  Top Layer w0.254: 23.7K.2 11.4,15.16 9.65,15.16
  Bottom Layer w0.254: v1(11.42,15.22) 11.42,14.09 10.3,12.98 33PF.2 9.55,13.01 124K#2.1
$1N3046: length 4.5
  Top Layer w0.254: 4.7UF.1 12.79,6 F1.2 13.98,4.8 U6.3
$1N3061: length 5.8
  Top Layer w0.254: 8.87K.2 v1(11.1,32.76) U3.3
  Bottom Layer w0.254: v1(11.1,32.76) 9.54,32.76 124K.1 9.09,32.3 7.27,32.3 47PF.1
$1N3102:
  vias: v1(16.82,2.23)
$1N13243:
  vias: v1(61.24,6.97)
$1N13247:
  vias: v1(63.46,6.98)
$1N13249: length 1.6
  Top Layer w0.254: 10K#2.2 34.95,9.58 U15.8
$1N13864: length 7.5
  Top Layer w0.254: 22PF#2.1 53.29,3.42 X1.1 50.62,6.08 U14.6
$1N13870: length 7.6
  Top Layer w0.254: 22PF.2 47.15,3.42 X1.2 50.12,6.4 U14.5
$1N14240: length 2.2
  Top Layer w0.254: v1(44.63,11.88) 44.65,11.86 U14.61
  Bottom Layer w0.254: v1(44.63,11.88) 43.99,11.88 10k.2
$1N18673: length 4.5
  Top Layer w0.254: 104#7.2 73.3,35.45 v1(73.3,33.71) 73.3,33.65 220R.2 75.03,31.81 U8.5
$1N18685: length 4.9
  Top Layer w0.254: U9.5 68.03,31.68 220R#2.2 104#6.2
  vias: v1(65.96,35.38)
$1N18690: length 5.8
  Top Layer w0.254: 220R.1 73.85,31.12 73.85,30 74.11,29.74 220R#3.1 75.45,29.74 75.68,29.98 U8.6
$1N18696: length 2.1
  Top Layer w0.254: U8.8 76.98,29.78 100R.1
$1N18706: length 5.5
  Top Layer w0.254: U9.6 68.74,30.68 220R#4.1 67.84,29.78 67.16,29.78 66.83,30.11 66.83,31.01 220R#2.1
$1N18712: length 2.2
  Top Layer w0.254: 100R#2.1 70.04,29.78 U9.8
$1N18744: length 4.4
  Top Layer w0.254: 10K#8.2 66.73,21.71 IC1.5 69.03,23.06 200K#3.2
$1N18747: length 5.6
  Top Layer w0.254: 10K#10.2 70.89,16.4 70.89,19.24 69.7,20.44 IC1.6
$1N18750: length 4.2
  Top Layer w0.254: 10K#11.2 72.67,17.82 74.02,19.17 IC1.2
$1N18753: length 2.4
  Top Layer w0.254: IC1.8 66.71,17.9 104#5.1
  vias: v1(66.62,18.15)
$1N18755: length 8.8
  Top Layer w0.254: IC1.7 69.95,19.17 70.49,18.63 70.49,17.68 70.08,17.27 69.18,17.27 68.61,16.7 100R#4.1 68.61,15.33 68.94,15 69.91,15 10K#10.1
$1N18758: length 4.7
  Top Layer w0.254: IC1.1 74.7,17.77 100R#3.1 72.83,14.22 10K#11.1
$1N18785: length 4.6
  Top Layer w0.254: IC1.3 74.94,20.44 75.86,21.35 200K#4.2 77.19,21 77.19,20.13 10K#9.2
$1N49088: length 2.4
  Top Layer w0.254: 17.3,34.52 17.3,36.62 104#9.1
$1N49141: length 10.7
  Top Layer w0.254: 15.32,36.73 14.86,36.26 U16.4
  Top Layer w0.762: 4.7R.2 19.82,31.39 15.97,31.39 14.86,32.5 U16.4
$1N49155: length 6.4
  Top Layer w0.762: U16.3 16.13,32.91 16.33,32.71 19.11,32.71 v1(20.43,34.03)
$1N49185: length 2.2
  Top Layer w0.762: v1(20.38,30.02) 19.61,30.02 18.57,28.97
$1N49210: length 11.7
  Top Layer w0.762: v1(22.3,34.03) 25.72,37.45 Q27.1 28.3,42.65 10K.1
$1N49246: length 6.7
  Top Layer w0.762: Q28.2 27.77,32 4.7R.1
$1N49364: length 9
  Top Layer w0.762: 10K#6.2 28.14,24.67 Q28.1 25.83,26.44 v1(22.3,29.97)
$1N49733: length 6.8
  Top Layer w0.762: Q30.2 54.24,32.89 4.7R#2.1
$1N50072: length 15.4
  Top Layer w0.762: v1(55.17,33.78) 53.61,35.34 53.61,42.21 51.27,44.55 Q29.1 50.79,44.9 10K#4.1
$1N50092: length 12.6
  Top Layer w0.762: 2R#3.1 54.26,28.9 49.13,28.9 Q30.1 46.11,25.88 10K#7.2
  vias: v1(55.18,29.87)
$1N50323: length 6.1
  Top Layer w0.254: 104#10.1 58.78,36.31 58.78,34.27
  Top Layer w0.762: 4.7R#2.2 57.89,31.85 58.78,32.74 58.78,34.27
$1N50327: length 4.4
  Top Layer w0.762: 60.05,34.27 v1(60.05,33.07)
  Bottom Layer w0.762: v1(57.15,33.78) 59.34,33.78 v1(60.05,33.07)
$1N50344: length 7
  Top Layer w0.762: U17.8 62.59,29.84 62,30.43 57.74,30.43 57.23,29.92 v1(57.15,29.92)
$1N50364: length 2.5
  Top Layer w0.254: 61.32,34.27 61.32,36.37 104#10.2

## Copper pours and planes (outline as drawn; the poured copper is in the pictures)
5V on Top Layer: 11.47,5.76 11.47,4.8 13.8,4.8 13.8,3.54 1.62,3.54 1.62,5.76
12V on Top Layer: 10.96,21.26 3.45,21.26 1.78,21.25 1.78,23.43 10.96,23.43
24V on Top Layer: 1.41,15 5.54,15 5.54,13.33 1.41,13.33
24V on Top Layer: 1.43,32.41 5.56,32.41 5.56,30.89 1.43,30.89
24V_P on Bottom Layer: 13.28,62.03 17.54,62.03 17.54,53.79 13.28,53.79
GND on Top Layer: 20.66,0.41 0.36,0.41 0.36,40.03 14.18,40.03 14.18,17.81 20.66,17.81
GND on Bottom Layer: 25.05,50.02 52.5,50.02 52.5,21.89 25.05,21.89
GND on Bottom Layer: 78.81,50.14 78.63,50.14 78.63,40.06 52.7,40.06 52.7,50.14 24.76,50.14 24.76,41.4 -1.1,41.4 -1.1,50.14 -1.2,50.14 -1.2,64.01 78.81,64.01
GND on Bottom Layer: 78.73,0 21.76,0 21.76,0.15 0,0.15 0,14.79 0,41.25 24.76,41.25 24.76,21.59 52.8,21.59 52.8,39.93 78.73,39.93
GND on 内层1: 63.26,19 63.21,19 63.21,12.42 80.38,12.42 80.38,0.15 56.12,0.15 56.12,0.2 0.17,0.2 0.17,0.4 0,0.4 0,21.46 0.17,21.46 0.17,39.93 24.4,39.93 24.4,21.3 52.88,21.3 52.88,39.6 63.26,39.6
GND on 内层1: 25.32,22.04 25.32,40.59 -4.81,40.59 -4.81,66.75 14.24,66.75 14.24,66.95 39.13,66.95 39.13,67 81.09,67 81.09,40.18 52.44,40.18 52.44,22.04
GND on 内层1: 63.82,39.77 78.25,39.77 78.25,12.8 63.82,12.8
GND on Inner2: 78.4,40.18 52.58,40.18 52.58,21.89 25.19,21.89 25.19,41.45 0,41.45 0,62.17 78.4,62.17
GND on Inner2: 63.21,39.58 63.21,21.31 63.31,21.31 63.31,12.47 79.01,12.47 79.01,0 0,0 0,41.12 24.66,41.12 24.66,21.31 52.95,21.31 52.95,39.58
GND on Inner2: 63.62,39.82 78.56,39.82 78.56,12.75 63.62,12.75
CAP_N on Top Layer: 67.07,40.74 59.86,40.74 59.86,39.32 54.45,39.32 54.45,49.13 59.86,49.13 59.86,45.26 67.07,45.26
$1N3042 on Top Layer: 7.08,13.58 7.08,12.67 7.47,12.67 7.47,7.95 4.74,7.95 4.74,12.67 5.78,12.67 5.78,13.58
$1N3043 on Top Layer: 7.21,31.15 7.21,30.04 7.85,30.04 7.85,25.44 4.51,25.44 4.51,30.04 5.89,30.04 5.89,31.15
$1N49246 on Top Layer: 25.98,32.06 25.98,36.01 30.6,36.01 30.6,43.74 24.42,43.74 24.42,49.31 28.92,49.31 28.92,53.02 37.3,53.02 37.3,32.06
$1N49733 on Top Layer: 50.67,31.95 39.79,31.95 39.79,53.03 46.86,53.03 46.86,49.76 52.46,49.76 52.46,46.05 46.86,46.05 46.86,41.19 52.05,41.19 52.05,38.75 46.86,38.75 46.86,35.76 50.67,35.76

Small or netless copper shapes (teardrops, artwork), in the pictures only: 265 on Top Layer, 74 on Bottom Layer

## Text on the board
Top Silkscreen Layer: H | L | G | R | T
